# Altium schematic sheet USB_UART_Prog.SchDoc
size A4; SheetNumber: 8; SheetTotal: 8
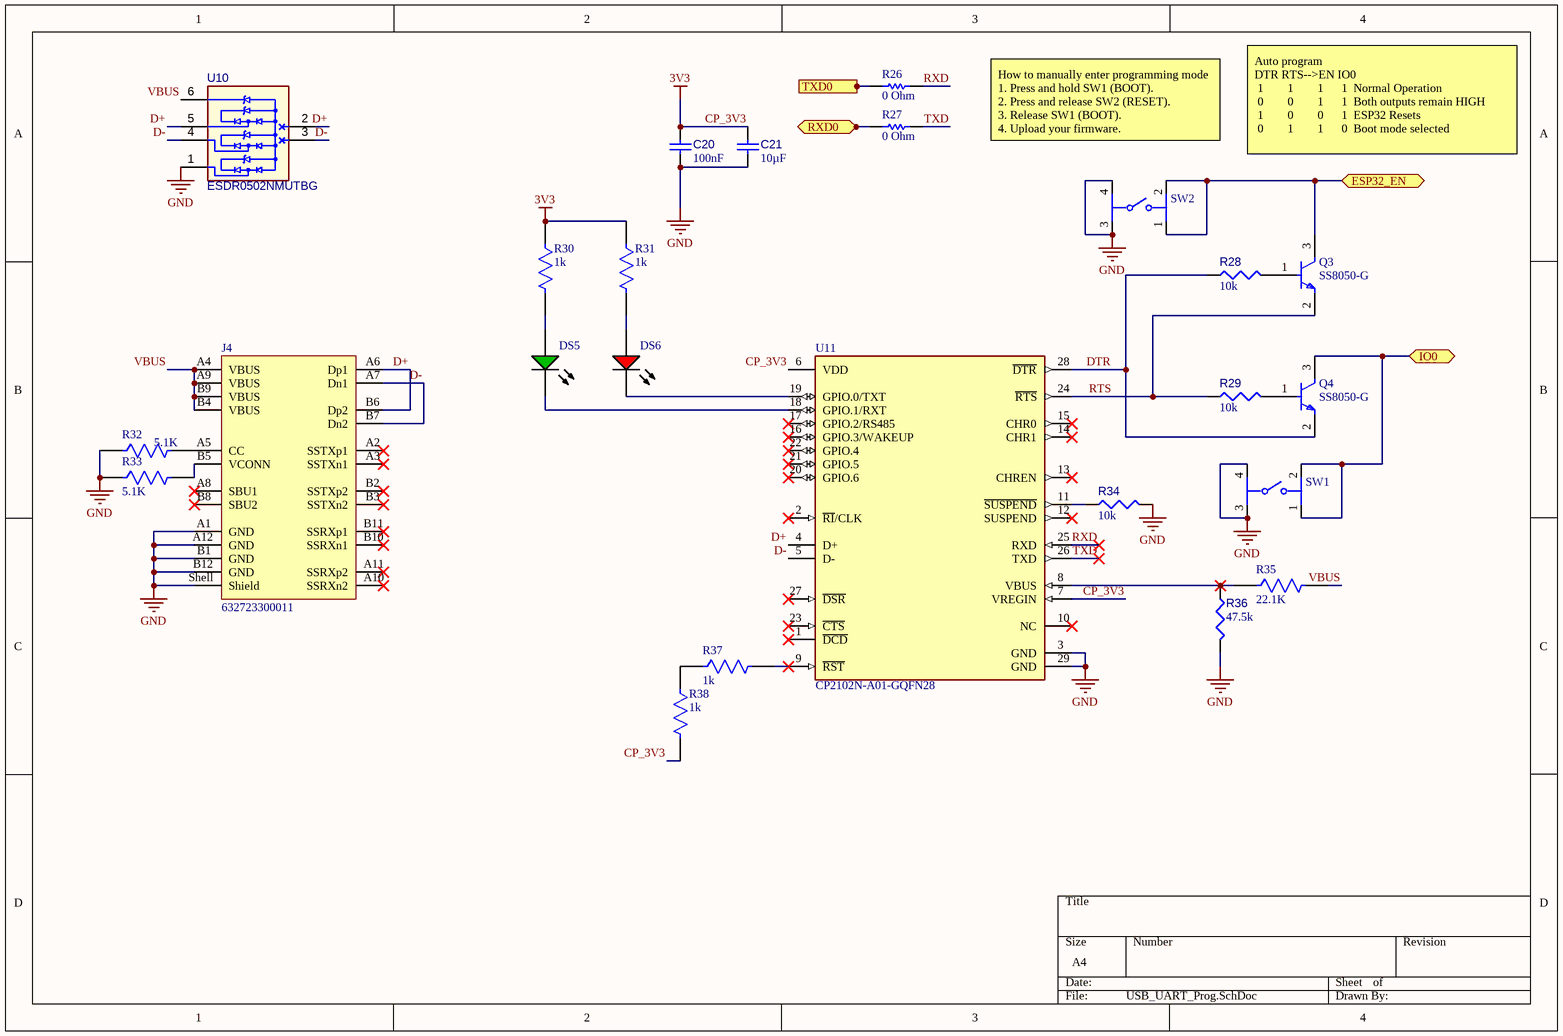
[diagram p0: USB_UART_Prog.SchDoc]

## Parts
C20  value 100nF  [CAPC1005X56X25LL10T15]  (hidden comment: Capacitor 0.1 uF +/- 5% 16 V 0402)
C21  value 10µF  [CAPC0402(1005)60_L]  (hidden comment: Capacitor 10µF +/-40% 6.3V 0402)
DS5  LTL-1CHG  [LTST-LTL-1CHG-2]  (value not drawn)
DS6  WP7113SRD/D  [KING-WP7113SRDD_V]  (value not drawn)
J4  632723300011  [632723300011]
Q3  SS8050-G  [FP-SS8050-G-MFG]
Q4  SS8050-G  [FP-SS8050-G-MFG]
R26  0 Ohm  [RESC1608X55X25ML10T15]
R27  0 Ohm  [RESC1608X55X25ML10T15]
R28  value 10k  [RESC0402(1005)_L]  (hidden comment: 10KR2F)
R29  value 10k  [RESC0402(1005)_L]  (hidden comment: 10KR2F)
R30  1k  [FP-RC0805-0_6-MFG]
R31  1k  [FP-RC0805-0_6-MFG]
R32  5.1K  [FP-RT1206-MFG]
R33  5.1K  [FP-RT1206-MFG]
R34  value 10k  [RESC0402(1005)_L]  (hidden comment: 10KR2F)
R35  22.1K  [FP-RT0603-MFG]
R36  value 47.5k  [RESC0402(1005)_L]  (hidden comment: Resistor 47K5 +/-1 % 0402 63 mW)
R37  1k  [FP-RC0805-0_6-MFG]
R38  1k  [FP-RC0805-0_6-MFG]
SW1  1301.9320  [FP-1301_9320-MFG]  (value not drawn)
SW2  1301.9320  [FP-1301_9320-MFG]  (value not drawn)
U10  ESDR0502NMUTBG  [ONSC-UDFN-6-517AA-01_V]
U11  CP2102N-A01-GQFN28  [FP-CP2102N-A01-GQFN28-MFG]

## Ports
ESP32_EN (bidir), IO0 (bidir), RXD0 (bidir), TXD0 (in)

## Nets
CP_3V3: C20.1 C21.1 R30.1 R31.1 R38.2 U11.6(VDD) U11.7(VREGIN)  [also labelled 3V3]
GND: C20.2 C21.2 J4.A1(GND) J4.A12(GND) J4.B1(GND) J4.B12(GND) J4.Shell(Shield) R32.1 R33.1 R34.2 R36.2 SW1.3 SW1.4 SW2.3 SW2.4 U10.1(GND) U11.3(GND) U11.29(GND)
D+: J4.A6(Dp1) J4.B6(Dp2) U10.2(NC) U10.5(D+) U11.4(D+)
D-: J4.A7(Dn1) J4.B7(Dn2) U10.3(NC) U10.4(D-) U11.5(D-)
DTR: Q4.2(E) R28.1 U11.28(~{DTR})
ESP32_EN: Q3.3(C) SW2.1 SW2.2 ; port ESP32_EN
IO0: Q4.3(C) SW1.1 SW1.2 ; port IO0
RTS: Q3.2(E) R29.1 U11.24(~{RTS})
RXD: R26.2 U11.25(RXD)
RXD0: R27.1 ; port RXD0
TXD: R27.2 U11.26(TXD)
TXD0: R26.1 ; port TXD0
VBUS: J4.A4(VBUS) J4.A9(VBUS) J4.B4(VBUS) J4.B9(VBUS) R35.2 U10.6(VBUS)
NetDS5_1: DS5.1(A) R30.2
NetDS5_2: DS5.2(K) U11.18(GPIO.1/RXT)
NetDS6_1: DS6.1(A) R31.2
NetDS6_2: DS6.2(K) U11.19(GPIO.0/TXT)
NetJ4_A5: J4.A5(CC) R32.2
NetJ4_B5: J4.B5(VCONN) R33.2
NetQ3_1: Q3.1(B) R28.2
NetQ4_1: Q4.1(B) R29.2
NetR34_1: R34.1 U11.11(~{SUSPEND})
NetR35_1: R35.1 R36.1 U11.8(VBUS)
NetR37_1: R37.1 R38.1
NetR37_2: R37.2 U11.9(~{RST})

Not connected (* = marked no-connect by the designer): J4 A2(SSTXp1)* A3(SSTXn1)* A8(SBU1)* A10(SSRXn2)* A11(SSRXp2)* B2(SSTXp2)* B3(SSTXn2)* B8(SBU2)* B10(SSRXn1)* B11(SSRXp1)*; U11 1(~{DCD})* 2(~{RI}/CLK)* 10(NC)* 12(SUSPEND)* 13(CHREN)* 14(CHR1)* 15(CHR0)* 16(GPIO.3/WAKEUP)* 17(GPIO.2/RS485)* 20(GPIO.6)* 21(GPIO.5)* 22(GPIO.4)* 23(~{CTS})* 27(~{DSR})*

## Notes on the sheet
- How to manually enter programming mode
  1. Press and hold SW1 (BOOT).
  2. Press and release SW2 (RESET).
  3. Release SW1 (BOOT).
  4. Upload your firmware.
- Auto program
  DTR RTS-->EN IO0
  1        1        1      1  Normal Operation
  0        0        1      1  Both outputs remain HIGH
  1        0        0      1  ESP32 Resets
  0        1        1      0  Boot mode selected

## Library data of the parts
C20 = CMP-001-00001-6: Chip Capacitor, 0.1 uF, +/- 5%, 16 V, 0402 (1005 Metric); Capacitor Type: Ceramic; Voltage Rating: 16V; Max Operating Temperature: 125°C; Min Operating Temperature: -55°C; Case/Package: 0402; Mounting Technology: SM; Pins: 2; Tolerance: 5%; RoHS Compliant: True
C21 = CMP-001-00074-3: Chip Capacitor, 10µF +/-40%, 6.3V, 0402, Thickness 0.6 mm; Tolerance: 10%; Case/Package: 0402; Pins: 2; Mounting Technology: SMT; Voltage Rating: 6.3V; Max Operating Temperature: 85°C; Min Operating Temperature: -55°C
DS5 = CMP-007-00019-2: LED Uni-Color Green, 100 mW, 30 mA, -55 to 100 degC, 2-Pin THD, RoHS, Bulk; Manufacturer: Lite-On; Power: 100mW; Forward Voltage: 2.6V; Forward Current: 30mA; Nominal Vf: 2.1V; Lens Style: Dome; Viewing Angle: 60degrees; Luminous Intensity: 12.6mcd; Max Operating Temperature: 100°C; Case/Package: Radial; Package Reference: LTL-1CHG; Manufacturer URL: http://www.us.liteon.com/; Package Quantity: 1000; Colour: Green; Packaging: Bulk; RoHS Compliant: True; Datasheet URL: http://datasheet.octopart.com/LTL-1CHG-Lite-On-datasheet-143841.pdf; Package Description: 2-Pin Through Hole Device, Dia 3.8 mm; Min Operating Temperature: -55°C; Mounting Technology: TH; Pins: 2; Illumination Colour: Green; Datasheet Version: Mar-00
DS6 = CMP-007-00033-2: The Super Bright Red Source Color Device, 1.85 V, -40 to 85 degC, 2-Pin THD, RoHS, Tape and Reel; Manufacturer: Kingbright; Nominal Vf: 1.85V; Luminous Intensity: 300mcd; Viewing Angle: 30degrees; Lens Style: Diffused; RoHS Compliant: True; Datasheet Version: Rev. 6A, 07/2016; Illumination Colour: Red; Case/Package: Radial; Package Reference: WP7113SRDD; Package Quantity: 500; Datasheet URL: http://www.kingbrightusa.com/images/catalog/SPEC/WP7113SRD-D.pdf; Colour: Red; Packaging: Bulk; Forward Voltage: 1.85V; Mounting Technology: TH; Package Description: 2-Pin Through Hole Device, Dia 5.9 mm, Body Length 8.6 mm
J4 = CMP-1502-03214-4: Conn USB 3.1 Type C RCP 24 POS 0.5mm/0.4mm Solder RA SMD/Thru-Hole 24 Terminal 1 Port T/R; Gender: Receptacle; Pin Length: 1.9mm; Insulation Resistance: 1GΩ; Current Rating: 5A; USB Standard: USB 3.1; Contact Resistance: 30mΩ; Voltage Rating: 20V; Number of Contacts: 24; Orientation: Horizontal; Mount: Surface Mount, Through Hole; Connector Type: USB; Number of Pins: 24; Height: 3.21mm; Max Operating Temperature: 105°C; Contact Material: Gold, Nickel; RoHS: Compliant; Min Operating Temperature: -40°C; Packaging: Tape and Reel
Q3 Q4 = CMP-20235-000001-1: NPN TRANSISTOR 1.5A 40V SOT-23 R; Transition Frequency: 100MHz; Max Breakdown Voltage: 25V; Collector Emitter Voltage (VCEO): 400mV; Max Power Dissipation: 300mW; Max Collector Current: 1.5A; Case/Package: TO-236-3; Packaging: Tape and Reel; RoHS Compliant: Yes; Mount: Surface Mount; Collector Emitter Breakdown Voltage: 25V
R26 R27 = CMP-2100-03667-1: Chip Resistor, 0 Ohm, +/- 5%, 0.1 W, -55 to 155 degC, 0603 (1608 Metric), RoHS, Tape and Reel RC0603JR-070RL; Manufacturer: Yageo; Temperature Coefficient: 200ppm/degreesC; Voltage Rating: 50V; Power Rating: 100mW; Resistance: 0mOhm; Width: 0.8mm; Max Operating Temperature: 155degC; Tolerance: 5%; Package Reference: 0603; Height: 0.45mm; Depth: 0.8mm; Package Description: 2-Pin Surface Mount Device, Body 1.6 x 0.8 mm; Termination: SMD/SMT; Package Quantity: 5000; Case/Package: 0603; Case Code (Imperial): 0603; Radiation Hardening: No; Number of Pins: 2; Length: 1.6mm; Lead Free: LeadFree; Voltage Rating (DC): 50V; Military Standard: Not; Datasheet URL: http://www.yageo.com/NewPortal/yageodocoutput?fileName=/pdf/R-Chip/PYu-RC_Group_51_RoHS_L_5.pdf; Manufacturer URL: http://www.yageo.com/; Packaging: TapeandReel; Case Code (Metric): 1608; Min Operating Temperature: -55degC; Composition: ThickFilm; RoHSCompliant: true; Contact Plating: Tin; Datasheet Version: Rev. 5, 10/2016; REACH SVHC: NoSVHC
R28 R29 R34 = CMP-009-00066-2: 10K 0.063W 1% 0402 (1005 Metric)  SMD; Power: 63mW; Case/Package: 0402; Mounting Technology: SMT; Pins: 2; Tolerance: 1%
R30 R31 R37 R38 = CMP-03412-037820-1: RC0805JR-071KL, RES SMD 1K OHM 5% 1/8W 0805; Voltage Rating: 150V; Resistance: 1kR; Max Power Dissipation: 125mW; Temperature Coefficient: 100ppm/°C; Size Code: 0805; Series: RC; Number of Terminations: 2; Tolerance: 5%; Features: Moisture Resistant; Termination: SMD/SMT; Min Operating Temperature: -55°C; Construction: Rectangular; Lead Free: Lead Free; Contact Plating: Tin; Radiation Hardening: No; Packaging: Tape and Reel; Length: 2mm; Resistor Type: Thick Film; Military Standard: Not; Case Code (Metric): 2012; Depth: 1.25mm; Case Code (Imperial): 0805; Power Rating: 125mW; Max Operating Temperature: 155°C; Resistance Tolerance: 5%; RoHS Compliant: Yes; Case/Package: 0805
R32 R33 = CMP-03412-000130-1: RES SMD 5.1K OHM 0.1% 1/4W 1206 RT1206BRE075K1L; Manufacturer: Yageo; Tolerance: 0.005; Resistance: 5.1KΩ; Power Rating: 0.25W; Voltage Rating: 200V; Value: 5.1KΩ; Temperature Coefficient: 50 ppm/°C; Octopart: https://octopart.com/rt1206bre075k1l-yageo-1210412; Digikey Description: RES SMD 5.1K OHM 0.1% 1/4W 1206; RoHS: TRUE; Device Class L2: Resistors; Automotive: No; Height: 0.65mm; ComponentLink2Description: Datasheet; Device Class L1: Passive Components; Package: RT1206; Device Class L3: Chip SMD Resistors; Ipc Land Pattern Name: RESC310160X55; Lead Free: Yes; Footprint Url: http://www.yageo.com/exep/pages/download/literatures/PYu-R_Mount_10.pdf; Series: RT; Temperature Range High: +155°C; Temperature: -55°C to +155°C; Temperature Range Low: -55°C; Manufacturer Part Number: RT1206BRE075K1L; ComponentLink2URL: http://www.yageo.com/documents/recent/PYu-RT_1-to-0.01_RoHS_L_9.pdf; Category: Res; Composition: Thin Film
R35 = CMP-03412-003430-1: RES SMD 22.1K OHM 1% 1/10W 0603 RT0603FRD0722K1L; Manufacturer: Yageo; Power Rating: 0.1W; Temperature Coefficient: 25 ppm/°C; Tolerance: 0.01; Value: 22.1KΩ; Voltage Rating: 75V; Lead Free: Yes; Device Class L1: Passive Components; Package: RT0603; Digikey Description: RES SMD 22.1K OHM 1% 1/10W 0603; Temperature Range High: +155°C; Device Class L3: Chip SMD Resistors; Height: 0.55mm; Composition: Thin Film; Temperature Range Low: -55°C; Automotive: No; Category: Res; Ipc Land Pattern Name: RESC16080X45; Series: RT; RoHS: TRUE; Octopart: https://octopart.com/rt0603frd0722k1l-yageo-71395326; Manufacturer Part Number: RT0603FRD0722K1L; ComponentLink2Description: Datasheet; Device Class L2: Resistors; Temperature: -55°C to +155°C; Footprint Url: http://www.yageo.com/exep/pages/download/literatures/PYu-R_Mount_10.pdf; ComponentLink2URL: http://www.yageo.com/documents/recent/PYu-RT_1-to-0.01_RoHS_L_9.pdf; Resistance: 22.1KΩ
R36 = CMP-009-00137-3: Chip Resistor, 47,5 kOhms, +/-1 %, 63 mW, -55 to 155 degC, 0402; Power: 63mW; Tolerance: 1%; Pins: 2; Case/Package: 0402; Min Operating Temperature: -55°C; Max Operating Temperature: 155°C
SW1 SW2 = CMP-26321-000001-1: SWITCH TACTILE SPST-NO 0.05A 12V; Manufacturer: Schurter; Electromechanical Life: 100000Cycles; Contact Current Rating: 50mA; Contact Resistance: 100mΩ; Operating Force: 1.6N; Height: 12.5mm; ComponentLink2Description: Datasheet; Temperature Range Low: -20°C; Device Class L1: Electromechanical; Voltage Rating Dc: 12V; Device Class L3: Tactile Switches; Throw Configuration: SPST-NO; ComponentLink2URL: https://www.schurter.com/en/datasheet/typ_6x6_mm_tact_switches.pdf; Lead Free: Yes; Temperature: -20°C to +70°C; Manufacturer Part Number: 1301.9320; Mount: Surface Mount; Digikey Description: SWITCH TACTILE SPST-NO 0.05A 12V; Device Class L2: Switches; Temperature Range High: +70°C; Category: Switch; RoHS: TRUE; Automotive: No; Octopart: https://octopart.com/1301.9320-schurter-6627962; Package: 0
U10 = CMP-004-00025-1: Ultra Low Capacitance ESD Protection Array for High Speed Data Line Protection, 6-Pin UDFN, Pb-Free, Tape and Reel; ComponentLink2Description: Datasheet; ComponentLink3URL: http://www.onsemi.com/pub_link/Collateral/517AA.PDF; Mounting Technology: SMT; ComponentLink1URL: http://www.onsemi.com/; Pins: 6; ComponentLink3Description: Package Specification; ComponentLink1Description: Manufacturer URL; ComponentLink2URL: http://www.onsemi.cn/pub_link/Collateral/ESDR0502N-D.PDF
U11 = CMP-08093-000004-1: IC BRIDGE USB TO UART 28QFN; Manufacturer: Silicon Labs; Standoff Height: 0mm; Max Junction Temp: +105°C; Usb Standard: USB 2.0; Number Of Ports: 1; Nominal Supply Current: 195-13700uA; Min Supply Voltage: 1.71V; Max Supply Voltage: 5.25V; Interface: UART,USB,RS-232,RS-485; Height: 0.8mm; Package: CP2102N-A01-GQFN28; Temperature Range Low: -40°C; Lead Free: Yes; Category: IC; Ambient Temperature Range High: +85°C; Device Class L3: USB Interface ICs; Octopart: https://octopart.com/cp2102n-a01-gqfn28-silicon+labs-74636024; Manufacturer Part Number: CP2102N-A01-GQFN28; Device Class L2: Interface ICs; ComponentLink2URL: https://media.digikey.com/pdf/Data%20Sheets/Silicon%20Laboratories%20PDFs/CP2102N_Rev.1.3_DS.pdf; Automotive: No; Temperature: -40°C to +85°C; Device Class L1: Integrated Circuits (ICs); Mouser Description: IC BRIDGE USB TO UART 28QFN; RoHS: TRUE; Ambient Temperature Range Low: -40°C; Temperature Range High: +85°C; Ipc Land Pattern Name: QFN50P500X500X75-28; Digikey Description: IC BRIDGE USB TO UART 28QFN; ComponentLink2Description: Datasheet